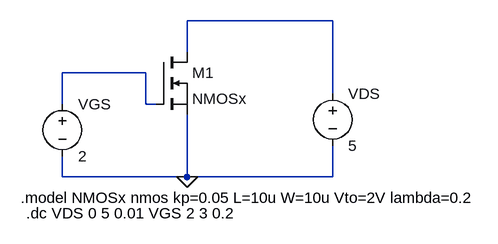
[diagram p0: schematic nMOS.asc]
nMOS.asc, the LTspice schematic file:
Version 4.1
SHEET 1 880 680
WIRE 432 48 208 48
WIRE 208 96 208 48
WIRE 144 128 16 128
WIRE 432 160 432 48
WIRE 16 176 16 128
WIRE 144 176 144 128
WIRE 160 176 144 176
WIRE 16 288 16 256
WIRE 208 288 208 192
WIRE 208 288 16 288
WIRE 432 288 432 240
WIRE 432 288 208 288
FLAG 208 288 0
SYMBOL nmos 160 96 R0
SYMATTR InstName M1
SYMATTR Value NMOSx
SYMBOL voltage 16 160 R0
WINDOW 123 0 0 Left 0
WINDOW 39 0 0 Left 0
SYMATTR InstName VGS
SYMATTR Value 2
SYMBOL voltage 432 144 R0
WINDOW 123 0 0 Left 0
WINDOW 39 0 0 Left 0
SYMATTR InstName VDS
SYMATTR Value 5
TEXT -48 320 Left 2 !.model NMOSx nmos kp=0.05 L=10u W=10u Vto=2V lambda=0.2
TEXT -40 344 Left 2 !.dc VDS 0 5 0.01 VGS 2 3 0.2

The netlist it stands for:
* nMOS.asc
M1 N001 N002 0 0 NMOSx
VGS N002 0 2
VDS N001 0 5
.model NMOS NMOS
.model PMOS PMOS
.lib standard.mos
.model NMOSx nmos kp=0.05 L=10u W=10u Vto=2V lambda=0.2
.dc VDS 0 5 0.01 VGS 2 3 0.2
.backanno
.end